# Altium schematic sheet Power_Distribution.SchDoc: Power Distributions
size A3; Organization: Altium Limited; Address1: L3, 12a Rodborough Rd; Address2: Frenchs Forest; Address3: NSW; Address4: Australia 2086
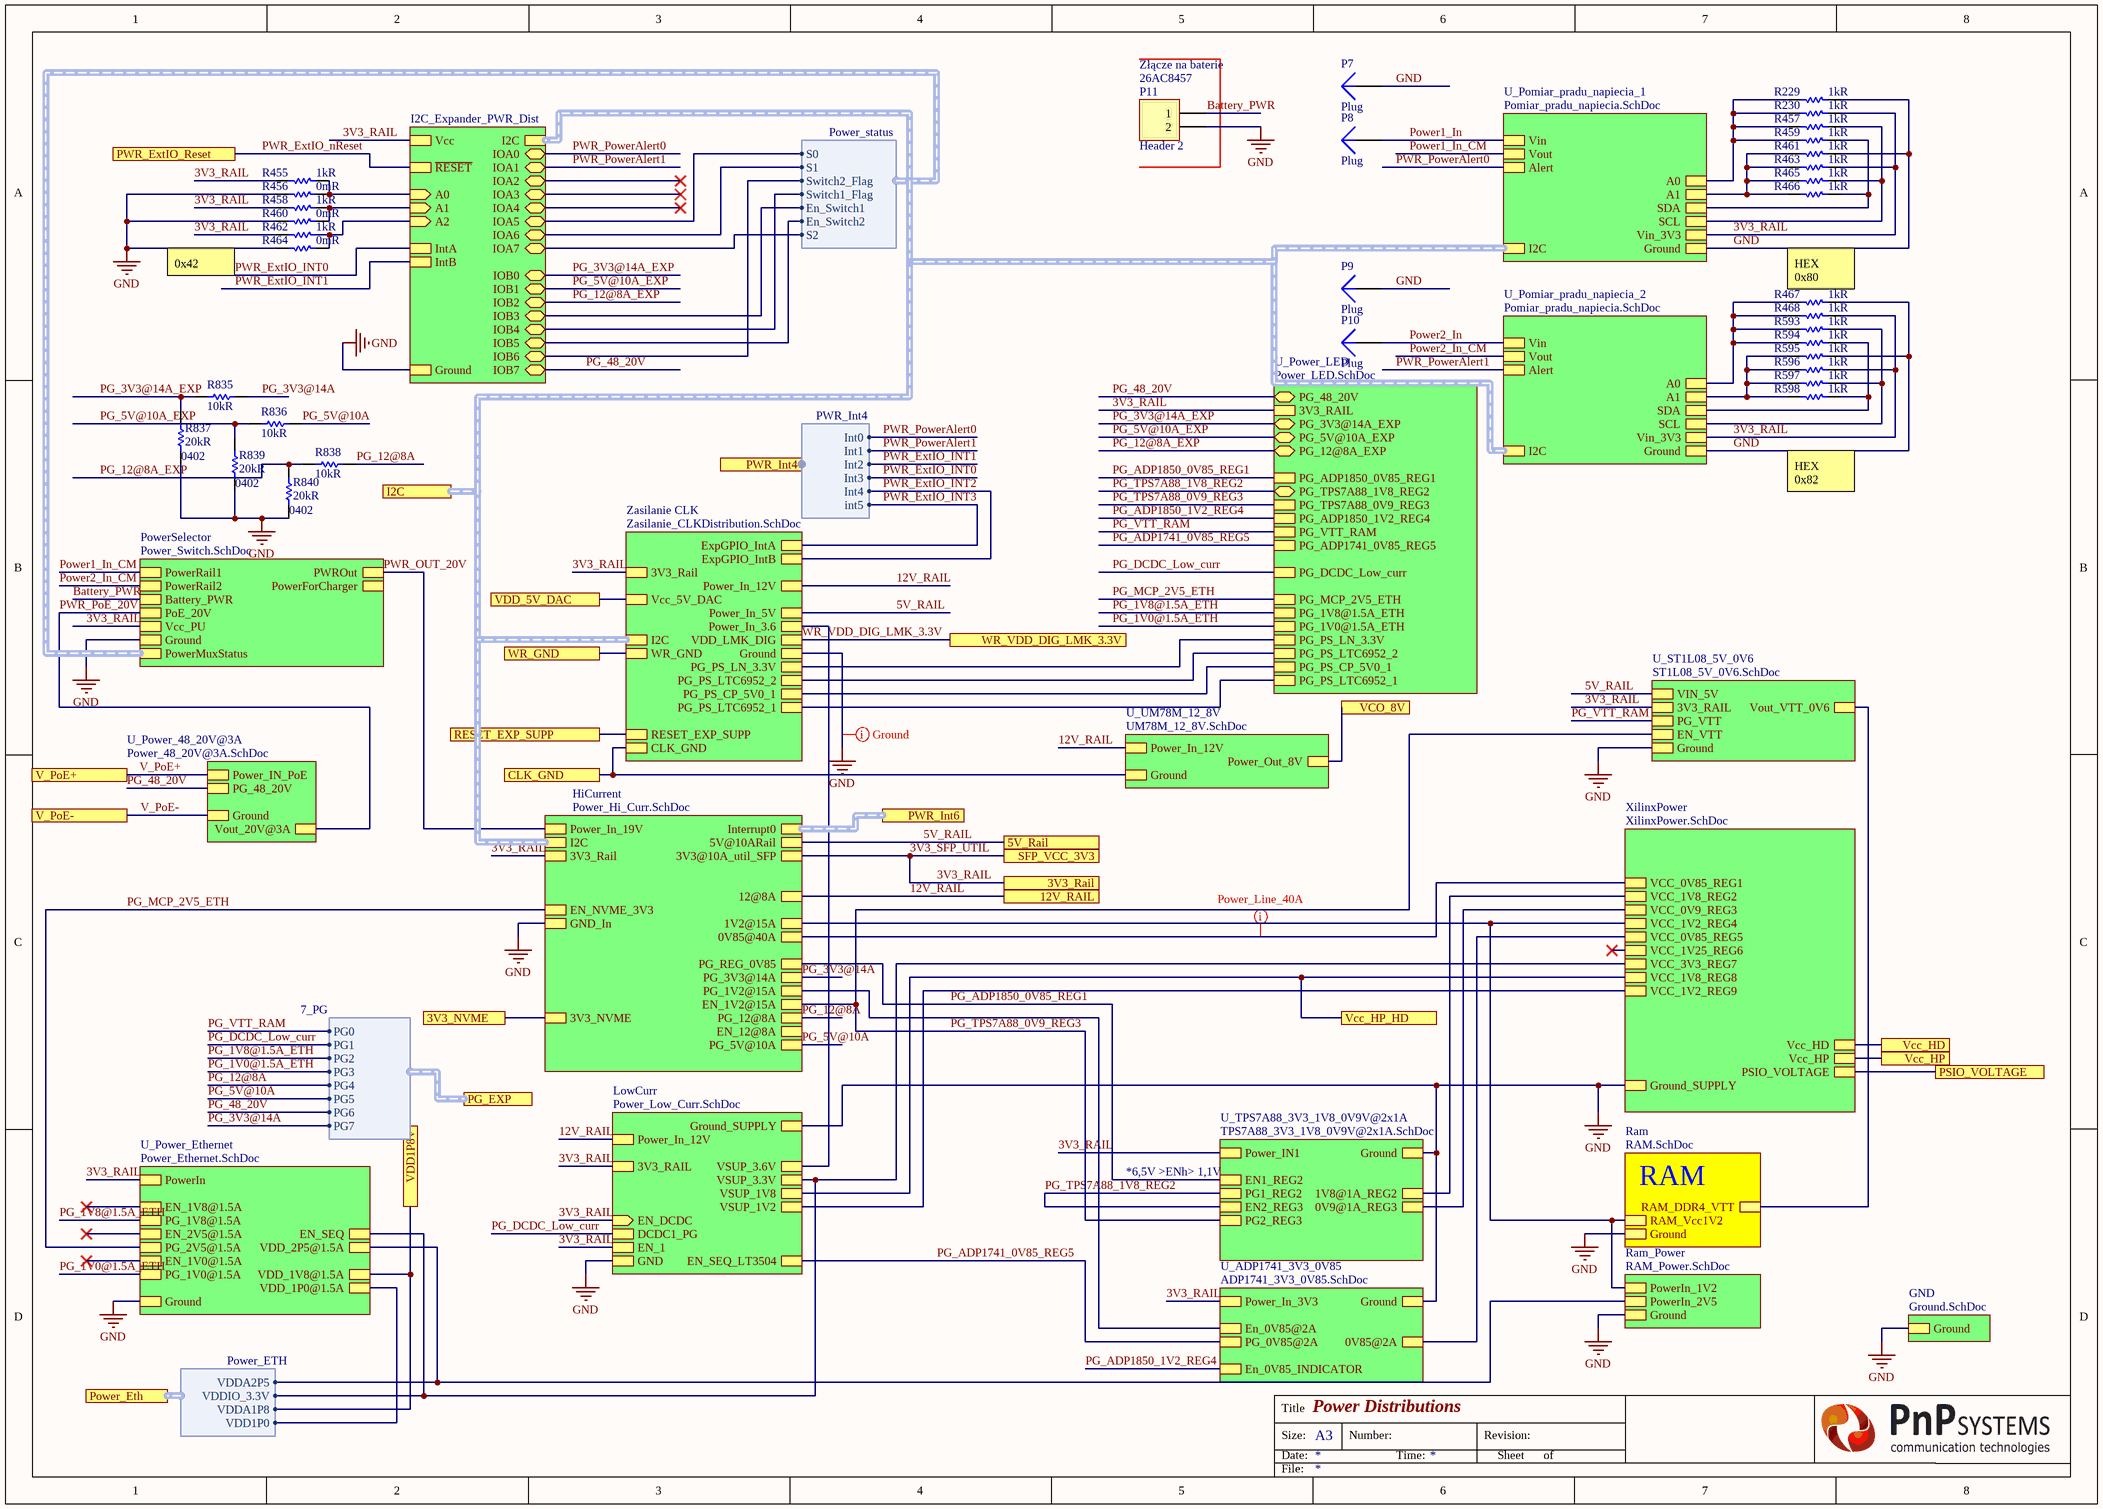
[diagram p0: Power_Distribution.SchDoc]

## Parts
P7  Plug  [PIN1]
P8  Plug  [PIN1]
P9  Plug  [PIN1]
P10  Plug  [PIN1]
P11  Header 2  Supplier Part Number 1: 26AC8457  [HDR1X2]
R229  1kR  [RES 0402/1005 RF KK]
R230  1kR  [RES 0402/1005 RF KK]
R455  1kR  [RES 0402/1005 RF KK]
R456  0mR  [RES 0402/1005 RF KK]
R457  1kR  [RES 0402/1005 RF KK]
R458  1kR  [RES 0402/1005 RF KK]
R459  1kR  [RES 0402/1005 RF KK]
R460  0mR  [RES 0402/1005 RF KK]
R461  1kR  [RES 0402/1005 RF KK]
R462  1kR  [RES 0402/1005 RF KK]
R463  1kR  [RES 0402/1005 RF KK]
R464  0mR  [RES 0402/1005 RF KK]
R465  1kR  [RES 0402/1005 RF KK]
R466  1kR  [RES 0402/1005 RF KK]
R467  1kR  [RES 0402/1005 RF KK]
R468  1kR  [RES 0402/1005 RF KK]
R593  1kR  [RES 0402/1005 RF KK]
R594  1kR  [RES 0402/1005 RF KK]
R595  1kR  [RES 0402/1005 RF KK]
R596  1kR  [RES 0402/1005 RF KK]
R597  1kR  [RES 0402/1005 RF KK]
R598  1kR  [RES 0402/1005 RF KK]
R835  10kR  [RES 0402/1005 RF KK]
R836  10kR  [RES 0402/1005 RF KK]
R837  20kR  Case/Package: 0402  [RES 0402/1005 RF KK]
R838  10kR  [RES 0402/1005 RF KK]
R839  20kR  Case/Package: 0402  [RES 0402/1005 RF KK]
R840  20kR  Case/Package: 0402  [RES 0402/1005 RF KK]

## Sub-sheets
GND = Ground.SchDoc: Ground
HiCurrent = Power_Hi_Curr.SchDoc: 0V85@40A, 1V2@15A, 3V3@10A_util_SFP, 12@8A, Power_In_19V, GND_In, I2C (harness PWR_Int4), 5V@10ARail, 3V3_Rail, Interrupt0 (harness PWR_Interrupt), EN_NVME_3V3, 3V3_NVME, PG_12@8A, PG_1V2@15A, PG_5V@10A, PG_REG_0V85, EN_1V2@15A, EN_12@8A, PG_3V3@14A
I2C_Expander_PWR_Dist = I2C_Expander.SchDoc: IOA7 (bidir), IOA3 (bidir), IOA6 (bidir), IOA1 (bidir), IOA0 (bidir), IOA5 (bidir), IOB1 (bidir), IOB2 (bidir), IOB5 (bidir), IOB6 (bidir), IOB7 (bidir), IntA, IntB, Ground, IOB4 (bidir), IOB3 (bidir), IOA2 (bidir), IOA4 (bidir), IOB0 (bidir), Vcc, ~{RESET}, I2C (harness PWR_Int4), A2 (in), A1 (in), A0 (in)
LowCurr = Power_Low_Curr.SchDoc: Power_In_12V, Ground_SUPPLY, DCDC1_PG, EN_1, VSUP_3.6V, VSUP_3.3V, VSUP_1V8, VSUP_1V2, 3V3_RAIL, GND, EN_DCDC (in), EN_SEQ_LT3504
PowerSelector = Power_Switch.SchDoc: PWROut, Battery_PWR, PowerRail2, PowerRail1, PowerMuxStatus (harness Power_status), Vcc_PU, PowerForCharger, Ground, PoE_20V
Ram = RAM.SchDoc: RAM_DDR4_VTT, RAM_Vcc1V2, Ground
Ram_Power = RAM_Power.SchDoc: PowerIn_1V2, Ground, PowerIn_2V5
U_ADP1741_3V3_0V85 = ADP1741_3V3_0V85.SchDoc: Power_In_3V3, 0V85@2A, En_0V85@2A, PG_0V85@2A, Ground, En_0V85_INDICATOR
U_Pomiar_pradu_napiecia_1 = Pomiar_pradu_napiecia.SchDoc: Vin_3V3, Vin, Vout, Alert, A0, A1, SDA, SCL, Ground, I2C (harness PWR_Int4)
U_Pomiar_pradu_napiecia_2 = Pomiar_pradu_napiecia.SchDoc: Vin_3V3, Vin, Vout, Alert, A0, A1, SDA, SCL, Ground, I2C (harness PWR_Int4)
U_Power_48_20V@3A = Power_48_20V@3A.SchDoc: Ground, Power_IN_PoE, Vout_20V@3A, PG_48_20V
U_Power_Ethernet = Power_Ethernet.SchDoc: VDD_2P5@1.5A, VDD_1V8@1.5A, PowerIn, Ground, VDD_1P0@1.5A, EN_1V8@1.5A, PG_2V5@1.5A, PG_1V8@1.5A, EN_1V0@1.5A, PG_1V0@1.5A, EN_2V5@1.5A, EN_SEQ
U_Power_LED = Power_LED.SchDoc: 3V3_RAIL, PG_3V3@14A_EXP (bidir), PG_5V@10A_EXP (bidir), PG_12@8A_EXP (bidir), PG_ADP1850_0V85_REG1, PG_TPS7A88_1V8_REG2 (bidir), PG_TPS7A88_0V9_REG3, PG_ADP1850_1V2_REG4, PG_VTT_RAM, PG_ADP1741_0V85_REG5, PG_DCDC_Low_curr, PG_48_20V (bidir), PG_PS_LN_3.3V, PG_PS_LTC6952_2, PG_PS_CP_5V0_1, PG_PS_LTC6952_1, PG_MCP_2V5_ETH, PG_1V8@1.5A_ETH, PG_1V0@1.5A_ETH
U_ST1L08_5V_0V6 = ST1L08_5V_0V6.SchDoc: VIN_5V, Vout_VTT_0V6, PG_VTT, EN_VTT, Ground, 3V3_RAIL
U_TPS7A88_3V3_1V8_0V9V@2x1A = TPS7A88_3V3_1V8_0V9V@2x1A.SchDoc: Power_IN1, Ground, 1V8@1A_REG2, 0V9@1A_REG3, PG2_REG3, PG1_REG2, EN2_REG3, EN1_REG2
U_UM78M_12_8V = UM78M_12_8V.SchDoc: Power_In_12V, Power_Out_8V, Ground
XilinxPower = XilinxPower.SchDoc: Ground_SUPPLY, PSIO_VOLTAGE, VCC_1V8_REG8, VCC_0V85_REG1, VCC_1V8_REG2, VCC_0V9_REG3, VCC_1V2_REG4, VCC_0V85_REG5, VCC_1V25_REG6, VCC_1V2_REG9, VCC_3V3_REG7, Vcc_HP, Vcc_HD
Zasilanie CLK = Zasilanie_CLKDistribution.SchDoc: Power_In_12V, Ground, Power_In_5V, Power_In_3.6, 3V3_Rail, VDD_LMK_DIG, Vcc_5V_DAC, WR_GND, CLK_GND, RESET_EXP_SUPP, I2C (harness PWR_Int4), ExpGPIO_IntB, ExpGPIO_IntA, PG_PS_LN_3.3V, PG_PS_LTC6952_2, PG_PS_CP_5V0_1, PG_PS_LTC6952_1

## Ports
3V3_NVME, 3V3_Rail, 5V_Rail, 12V_RAIL, CLK_GND, I2C (harness PWR_Int4), PG_EXP (harness 7_PG), Power_Eth (harness Power_ETH), PSIO_VOLTAGE, PWR_ExtIO_Reset, PWR_Int4 (harness PWR_Int4), PWR_Int6 (harness PWR_Interrupt), RESET_EXP_SUPP, SFP_VCC_3V3, V_PoE+, V_PoE-, Vcc_HD, Vcc_HP, Vcc_HP_HD, VCO_8V, VDD1P8V, VDD_5V_DAC, WR_GND, WR_VDD_DIG_LMK_3.3V

## Harnesses
Power_ETH: VDDA2P5, VDDIO_3.3V, VDDA1P8, VDD1P0
PWR_Int4: Int0, Int1, Int2, Int3, Int4, int5
Power_status: S0, S1, Switch1_Flag, Switch2_Flag, En_Switch1, En_Switch2, S2
7_PG: PG0, PG1, PG2, PG3, PG4, PG5, PG6, PG7

## Nets
GND: P7.1 P9.1 P11.2 R229.2 R456.2 R460.2 R461.2 R464.2 R467.2 R595.2 R837.2 R839.2 R840.2 ; sheet PowerSelector/Ground, sheet HiCurrent/GND_In, sheet LowCurr/Ground_SUPPLY, sheet LowCurr/GND, sheet Zasilanie CLK/Ground, sheet Ram_Power/Ground, sheet XilinxPower/Ground_SUPPLY, sheet Ram/Ground, sheet GND/Ground, sheet U_Power_Ethernet/Ground, sheet I2C_Expander_PWR_Dist/Ground, sheet U_Pomiar_pradu_napiecia_1/Ground, sheet U_Pomiar_pradu_napiecia_2/Ground, sheet U_TPS7A88_3V3_1V8_0V9V@2x1A/Ground, sheet U_ADP1741_3V3_0V85/Ground, sheet U_ST1L08_5V_0V6/Ground
3V3_NVME: port 3V3_NVME, sheet HiCurrent/3V3_NVME
3V3_RAIL: R230.2 R455.1 R458.1 R462.1 R463.2 R468.2 R596.2 ; port SFP_VCC_3V3, port 3V3_Rail, sheet PowerSelector/Vcc_PU, sheet HiCurrent/3V3@10A_util_SFP, sheet HiCurrent/3V3_Rail, sheet LowCurr/EN_1, sheet LowCurr/3V3_RAIL, sheet LowCurr/EN_DCDC, sheet Zasilanie CLK/3V3_Rail, sheet U_Power_Ethernet/PowerIn, sheet I2C_Expander_PWR_Dist/Vcc, sheet U_Pomiar_pradu_napiecia_1/Vin_3V3, sheet U_Pomiar_pradu_napiecia_2/Vin_3V3, sheet U_TPS7A88_3V3_1V8_0V9V@2x1A/Power_IN1, sheet U_ADP1741_3V3_0V85/Power_In_3V3, sheet U_ST1L08_5V_0V6/3V3_RAIL, sheet U_Power_LED/3V3_RAIL  [also labelled 3V3_SFP_UTIL]
5V_RAIL: port 5V_Rail, sheet HiCurrent/5V@10ARail, sheet Zasilanie CLK/Power_In_5V, sheet U_ST1L08_5V_0V6/VIN_5V
12V_RAIL: port 12V_RAIL, sheet HiCurrent/12@8A, sheet LowCurr/Power_In_12V, sheet Zasilanie CLK/Power_In_12V, sheet U_UM78M_12_8V/Power_In_12V
Battery_PWR: P11.1 ; sheet PowerSelector/Battery_PWR
CLK_GND: port CLK_GND, sheet Zasilanie CLK/CLK_GND, sheet U_UM78M_12_8V/Ground
PG_1V0@1.5A_ETH: sheet U_Power_Ethernet/PG_1V0@1.5A, sheet U_Power_LED/PG_1V0@1.5A_ETH, port PG_EXP.PG3
PG_1V8@1.5A_ETH: sheet U_Power_Ethernet/PG_1V8@1.5A, sheet U_Power_LED/PG_1V8@1.5A_ETH, port PG_EXP.PG2
PG_3V3@14A: R835.1 ; sheet HiCurrent/PG_3V3@14A, port PG_EXP.PG7
PG_3V3@14A_EXP: R835.2 R837.1 ; sheet I2C_Expander_PWR_Dist/IOB0, sheet U_Power_LED/PG_3V3@14A_EXP
PG_5V@10A: R836.1 ; sheet HiCurrent/PG_5V@10A, port PG_EXP.PG5
PG_5V@10A_EXP: R836.2 R839.1 ; sheet I2C_Expander_PWR_Dist/IOB1, sheet U_Power_LED/PG_5V@10A_EXP
PG_12@8A: R838.1 ; sheet HiCurrent/PG_12@8A, port PG_EXP.PG4
PG_12@8A_EXP: R838.2 R840.1 ; sheet I2C_Expander_PWR_Dist/IOB2, sheet U_Power_LED/PG_12@8A_EXP
PG_48_20V: sheet I2C_Expander_PWR_Dist/IOB7, sheet U_Power_48_20V@3A/PG_48_20V, sheet U_Power_LED/PG_48_20V, port PG_EXP.PG6
PG_ADP1741_0V85_REG5: sheet LowCurr/EN_SEQ_LT3504, sheet U_ADP1741_3V3_0V85/PG_0V85@2A, sheet U_Power_LED/PG_ADP1741_0V85_REG5
PG_ADP1850_0V85_REG1: sheet HiCurrent/PG_REG_0V85, sheet U_TPS7A88_3V3_1V8_0V9V@2x1A/EN1_REG2, sheet U_Power_LED/PG_ADP1850_0V85_REG1
PG_ADP1850_1V2_REG4: sheet U_ADP1741_3V3_0V85/En_0V85_INDICATOR, sheet U_Power_LED/PG_ADP1850_1V2_REG4
PG_DCDC_Low_curr: sheet LowCurr/DCDC1_PG, sheet U_Power_LED/PG_DCDC_Low_curr, port PG_EXP.PG1
PG_MCP_2V5_ETH: sheet HiCurrent/EN_NVME_3V3, sheet U_Power_Ethernet/PG_2V5@1.5A, sheet U_Power_LED/PG_MCP_2V5_ETH
PG_TPS7A88_0V9_REG3: sheet HiCurrent/EN_1V2@15A, sheet U_TPS7A88_3V3_1V8_0V9V@2x1A/PG2_REG3, sheet U_ST1L08_5V_0V6/EN_VTT, sheet U_Power_LED/PG_TPS7A88_0V9_REG3
PG_TPS7A88_1V8_REG2: sheet U_TPS7A88_3V3_1V8_0V9V@2x1A/PG1_REG2, sheet U_TPS7A88_3V3_1V8_0V9V@2x1A/EN2_REG3, sheet U_Power_LED/PG_TPS7A88_1V8_REG2
PG_VTT_RAM: sheet U_ST1L08_5V_0V6/PG_VTT, sheet U_Power_LED/PG_VTT_RAM, port PG_EXP.PG0
Power1_In: P8.1 ; sheet U_Pomiar_pradu_napiecia_1/Vin
Power1_In_CM: sheet PowerSelector/PowerRail1, sheet U_Pomiar_pradu_napiecia_1/Vout
Power2_In: P10.1 ; sheet U_Pomiar_pradu_napiecia_2/Vin
Power2_In_CM: sheet PowerSelector/PowerRail2, sheet U_Pomiar_pradu_napiecia_2/Vout
PSIO_VOLTAGE: port PSIO_VOLTAGE, sheet XilinxPower/PSIO_VOLTAGE
PWR_ExtIO_INT0: sheet I2C_Expander_PWR_Dist/IntA, port PWR_Int4.Int3
PWR_ExtIO_INT1: sheet I2C_Expander_PWR_Dist/IntB, port PWR_Int4.Int2
PWR_ExtIO_INT2: sheet Zasilanie CLK/ExpGPIO_IntB, port PWR_Int4.Int4
PWR_ExtIO_INT3: sheet Zasilanie CLK/ExpGPIO_IntA, port PWR_Int4.int5
PWR_ExtIO_nReset: port PWR_ExtIO_Reset, sheet I2C_Expander_PWR_Dist/~{RESET}
PWR_OUT_20V: sheet PowerSelector/PWROut, sheet HiCurrent/Power_In_19V
PWR_PoE_20V: sheet PowerSelector/PoE_20V, sheet U_Power_48_20V@3A/Vout_20V@3A
PWR_PowerAlert0: sheet I2C_Expander_PWR_Dist/IOA0, sheet U_Pomiar_pradu_napiecia_1/Alert, port PWR_Int4.Int0
PWR_PowerAlert1: sheet I2C_Expander_PWR_Dist/IOA1, sheet U_Pomiar_pradu_napiecia_2/Alert, port PWR_Int4.Int1
RESET_EXP_SUPP: port RESET_EXP_SUPP, sheet Zasilanie CLK/RESET_EXP_SUPP
V_PoE+: port V_PoE+, sheet U_Power_48_20V@3A/Power_IN_PoE
V_PoE-: port V_PoE-, sheet U_Power_48_20V@3A/Ground
Vcc_HD: port Vcc_HD, sheet XilinxPower/Vcc_HD
Vcc_HP: port Vcc_HP, sheet XilinxPower/Vcc_HP
Vcc_HP_HD: port Vcc_HP_HD, sheet LowCurr/VSUP_1V8, sheet XilinxPower/VCC_1V8_REG8
VCO_8V: port VCO_8V, sheet U_UM78M_12_8V/Power_Out_8V
VDD1P8V: port VDD1P8V, sheet U_Power_Ethernet/VDD_1V8@1.5A, port Power_Eth.VDDA1P8
VDD_5V_DAC: port VDD_5V_DAC, sheet Zasilanie CLK/Vcc_5V_DAC
WR_GND: port WR_GND, sheet Zasilanie CLK/WR_GND
WR_VDD_DIG_LMK_3.3V: port WR_VDD_DIG_LMK_3.3V, sheet Zasilanie CLK/VDD_LMK_DIG
NetR229_1: R229.1 R230.1 R457.1 R459.1 ; sheet U_Pomiar_pradu_napiecia_1/A0
NetR455_2: R455.2 R456.1 ; sheet I2C_Expander_PWR_Dist/A0
NetR457_2: R457.2 R465.2 ; sheet U_Pomiar_pradu_napiecia_1/SCL
NetR458_2: R458.2 R460.1 ; sheet I2C_Expander_PWR_Dist/A1
NetR459_2: R459.2 R466.2 ; sheet U_Pomiar_pradu_napiecia_1/SDA
NetR461_1: R461.1 R463.1 R465.1 R466.1 ; sheet U_Pomiar_pradu_napiecia_1/A1
NetR462_2: R462.2 R464.1 ; sheet I2C_Expander_PWR_Dist/A2
NetR467_1: R467.1 R468.1 R593.1 R594.1 ; sheet U_Pomiar_pradu_napiecia_2/A0
NetR593_2: R593.2 R597.2 ; sheet U_Pomiar_pradu_napiecia_2/SCL
NetR594_2: R594.2 R598.2 ; sheet U_Pomiar_pradu_napiecia_2/SDA
NetR595_1: R595.1 R596.1 R597.1 R598.1 ; sheet U_Pomiar_pradu_napiecia_2/A1
(unnamed): sheet HiCurrent/0V85@40A, sheet XilinxPower/VCC_0V85_REG1
(unnamed): sheet HiCurrent/1V2@15A, sheet Ram_Power/PowerIn_1V2, sheet XilinxPower/VCC_1V2_REG4, sheet Ram/RAM_Vcc1V2
(unnamed): sheet HiCurrent/PG_1V2@15A, sheet U_ADP1741_3V3_0V85/En_0V85@2A
(unnamed): sheet LowCurr/VSUP_3.6V, sheet Zasilanie CLK/Power_In_3.6
(unnamed): sheet LowCurr/VSUP_3.3V, sheet XilinxPower/VCC_3V3_REG7, sheet U_Power_Ethernet/EN_SEQ, port Power_Eth.VDDIO_3.3V
(unnamed): sheet LowCurr/VSUP_1V2, sheet XilinxPower/VCC_1V2_REG9
(unnamed): sheet Zasilanie CLK/PG_PS_LN_3.3V, sheet U_Power_LED/PG_PS_LN_3.3V
(unnamed): sheet Zasilanie CLK/PG_PS_LTC6952_2, sheet U_Power_LED/PG_PS_LTC6952_2
(unnamed): sheet Zasilanie CLK/PG_PS_CP_5V0_1, sheet U_Power_LED/PG_PS_CP_5V0_1
(unnamed): sheet Zasilanie CLK/PG_PS_LTC6952_1, sheet U_Power_LED/PG_PS_LTC6952_1
(unnamed): sheet Ram_Power/PowerIn_2V5, sheet U_Power_Ethernet/VDD_2P5@1.5A, port Power_Eth.VDDA2P5
(unnamed): sheet XilinxPower/VCC_1V8_REG2, sheet U_TPS7A88_3V3_1V8_0V9V@2x1A/1V8@1A_REG2
(unnamed): sheet XilinxPower/VCC_0V9_REG3, sheet U_TPS7A88_3V3_1V8_0V9V@2x1A/0V9@1A_REG3
(unnamed): sheet XilinxPower/VCC_0V85_REG5, sheet U_ADP1741_3V3_0V85/0V85@2A
(unnamed): sheet Ram/RAM_DDR4_VTT, sheet U_ST1L08_5V_0V6/Vout_VTT_0V6
(unnamed): sheet U_Power_Ethernet/VDD_1P0@1.5A, port Power_Eth.VDD1P0
(unnamed): sheet I2C_Expander_PWR_Dist/IOA7, sheet PowerSelector/PowerMuxStatus.S2
(unnamed): sheet I2C_Expander_PWR_Dist/IOA6, sheet PowerSelector/PowerMuxStatus.S1
(unnamed): sheet I2C_Expander_PWR_Dist/IOA5, sheet PowerSelector/PowerMuxStatus.S0
(unnamed): sheet I2C_Expander_PWR_Dist/IOB5, sheet PowerSelector/PowerMuxStatus.En_Switch2
(unnamed): sheet I2C_Expander_PWR_Dist/IOB6, sheet PowerSelector/PowerMuxStatus.Switch2_Flag
(unnamed): sheet I2C_Expander_PWR_Dist/IOB4, sheet PowerSelector/PowerMuxStatus.Switch1_Flag
(unnamed): sheet I2C_Expander_PWR_Dist/IOB3, sheet PowerSelector/PowerMuxStatus.En_Switch1

## Buses and harness runs
harness port I2C = sheet HiCurrent/I2C = sheet I2C_Expander_PWR_Dist/I2C = sheet U_Pomiar_pradu_napiecia_1/I2C = sheet U_Pomiar_pradu_napiecia_2/I2C = sheet Zasilanie CLK/I2C
harness port PWR_Int6 = sheet HiCurrent/Interrupt0

## Layout directives
net class Power_Line_40A: (no net found under the mark)
net class Ground: GND

## Notes on the sheet
- (near P11) Złącze na baterie
- 0x42
- (near R467) HEX
  0x80
- HEX
  0x82
- *6,5V >ENh> 1,1V
- RAM
- Title
- Size:
- Date:
- A3
- Number:
- Time:
- Revision:
- Sheet
- of
- File:

## Library data of the parts
P11 = Header 2: 00000005000HDR ASSY F/L SQ STR; Manufacturer: TE Connectivity; Manufacturer Part Number: 640456-2; Connector Type: Connector,Pin,Plug,Header; Shrouded: No (Without); Contact Current Rating: 5A; Connector System: Wire-to-Board; Plating Thickness: 3.81um; PCB Mount Retention: Without; Contact Resistance: 6mR; Max Voltage Rating (AC): 250V; Number of Positions: 2; Gender: Male; Contact Style: Straight; Mating Connector Lock: Yes (With); PCB Mounting Orientation: Vertical; Circuit Application: Signal; Pitch: 2.54mm; PCB Thickness: 0.063inch; Tail Length: 0.14inch; Contact Post Length: 3.56mm; Approvals: CSA; LatestRevisionDate: 17-Jul-2002; LatestRevisionNote: Re-released for DXP Platform.; Publisher: Altium Limited; Supplier 1: Newark; RoHS: Yes; Category: Headers and Wire Housings; Pricing 1: 1=0,11200, 10=0,08100, 25=0,07600, 100=0,06900, 500=0,05800, 1000=0,05100, 2500=0,04700 (USD); Mount: Through Hole; Color: Natural,White,Beige; Contact Plating: Tin; Contact Material: Copper Alloy; Housing Material: Polyester; Housing Color: Natural; Contact Shape: Square; Min Operating Temperature: -67°C; Max Operating Temperature: 221°C; Package Quantity: 5000; Packaging: Bulk; Termination: Solder; Number of Rows: 1; Backwall/Post Interruptions: No (Without); Fastening Type: Friction; Contact Retention: No (Without); Mating Alignment: No (Without); Mating Retention: No (Without); PCB Mount Alignment: No (Without); Sealable: No (Without); Strain Relief: No (Without); Contact Gender: Male; Voltage Rating (AC): 250V; Orientation: Straight; Number of Contacts: 2; Current Rating: 5A; Mounting Ears: No (Without); Number of Poles: 2; Panel Mount Retention: No (Without); Voltage Rating: 250V; Working Voltage: 250V; Length: 7.62mm; Height: 7.87mm; Depth: 5.72mm; Lead Pitch: 2.54mm; Contact Mating Length: 7.49mm; Radiation Hardening: No; ELV: Compliant; Lead Free: Lead Free; Flammability Rating: UL94 V-0; REACH SVHC: No SVHC; ComponentLink1URL: https://datasheet.ciiva.com/709/eng-cd-640456-w1-709680.pdf?src-supplier=Digi-Key; ComponentLink1Description: https://datasheet.ciiva.com/709/eng-cd-640456-w1-709680.pdf?src-supplier=Digi-Key; ComponentLink2URL: https://datasheet.ciiva.com/3118/eng-ds-82056-mta-0608-3118497.pdf?src-supplier=Avnet; ComponentLink2Description: https://datasheet.ciiva.com/3118/eng-ds-82056-mta-0608-3118497.pdf?src-supplier=Avnet; ComponentLink3URL: https://datasheet.ciiva.com/14156/04384301-14156820.pdf?src-supplier=Distrelec; ComponentLink3Description: https://datasheet.ciiva.com/14156/04384301-14156820.pdf?src-supplier=Distrelec; ComponentLink4URL: https://datasheet.ciiva.com/16401/eng-ds-82056-mta-0608-16401289.pdf?src-supplier=Future+Electronics; ComponentLink4Description: https://datasheet.ciiva.com/16401/eng-ds-82056-mta-0608-16401289.pdf?src-supplier=Future+Electronics; ComponentLink5URL: https://datasheet.ciiva.com/25617/0900766b80027008-25617244.pdf?src-supplier=RSComponents; ComponentLink5Description: https://datasheet.ciiva.com/25617/0900766b80027008-25617244.pdf?src-supplier=RSComponents; ComponentLink6URL: https://datasheet.ciiva.com/11746/0900766b80eb7fdd-11746365.pdf?src-supplier=RSComponents; ComponentLink6Description: https://datasheet.ciiva.com/11746/0900766b80eb7fdd-11746365.pdf?src-supplier=RSComponents; ComponentLink7URL: https://datasheet.ciiva.com/7128/1866390-7128742.pdf?src-supplier=Newark; ComponentLink7Description: https://datasheet.ciiva.com/7128/1866390-7128742.pdf?src-supplier=Newark; ComponentLink8URL: https://datasheet.ciiva.com/16505/eng-ds-82056-mta-0608-16505419.pdf?src-supplier=Avnet+Asia; ComponentLink8Description: https://datasheet.ciiva.com/16505/eng-ds-82056-mta-0608-16505419.pdf?src-supplier=Avnet+Asia
R229 R230 R455 R457-R459 R461-R463 R465-R468 R593-R598 = Resistor: PANASONIC - ERJ-2RKF1001X - SMD Chip Resistor, 0402 [1005 Metric], 1 kohm, ERJ2R Series, 50 V, Thick Film, 100 mW; Temperature Coefficient: 100ppm/°C; Tolerance: 1%; Voltage Rating (DC): 50V; Power Rating: 100mW; Supplier 1: Digi-Key; Supplier Part Number 1: P1.00KLDKR-ND; Manufacturer: Panasonic; Manufacturer Part Number: ERJ-2RKF1001X; RoHS: Yes; Category: Chip SMD Resistors; Stock 1: 1864188; Pricing 1: 1=0,10000, 10=0,04300, 100=0,01740, 1000=0,00782, 2500=0,00678, 5000=0,00561 (USD); Mount: Surface Mount; Case/Package: 0402; Number of Pins: 2; Contact Plating: Tin; Case Code (Imperial): 0402; Case Code (Metric): 1005; Min Operating Temperature: -55°C; Max Operating Temperature: 155°C; Composition: Thick Film; Resistance: 1kR; Termination: SMD/SMT; Number of Terminations: 2; Military Standard: Not; Features: Automotive AEC-Q200; Packaging: Tape and Reel; Voltage Rating: 50V; Package Quantity: 1; Max Power Dissipation: 100mW; Working Voltage: 50V; Length: 1mm; Height: 0.35mm; Depth: 0.5mm; Width: 0.5mm; Radiation Hardening: No; Lead Free: Lead Free; REACH SVHC: No SVHC; ComponentLink1URL: https://datasheet.ciiva.com/11821/0900766b80f80784-11821203.pdf?src-supplier=RSComponents; ComponentLink1Description: https://datasheet.ciiva.com/11821/0900766b80f80784-11821203.pdf?src-supplier=RSComponents; ComponentLink2URL: https://datasheet.ciiva.com/7942/aoa0000ce2-7942426.pdf?src-supplier=Element14; ComponentLink2Description: https://datasheet.ciiva.com/7942/aoa0000ce2-7942426.pdf?src-supplier=Element14; ComponentLink3URL: https://datasheet.ciiva.com/16523/aoa0000ce2-16523834.pdf?src-supplier=Avnet+Asia; ComponentLink3Description: https://datasheet.ciiva.com/16523/aoa0000ce2-16523834.pdf?src-supplier=Avnet+Asia; ComponentLink4URL: https://datasheet.ciiva.com/17215/aoa0000ce2-17215308.pdf?src-supplier=Avnet+Europe; ComponentLink4Description: https://datasheet.ciiva.com/17215/aoa0000ce2-17215308.pdf?src-supplier=Avnet+Europe; ComponentLink5URL: https://datasheet.ciiva.com/22673/1678782-22673916.pdf?src-supplier=Element14; ComponentLink5Description: https://datasheet.ciiva.com/22673/1678782-22673916.pdf?src-supplier=Element14; ComponentLink6URL: https://datasheet.ciiva.com/28532/1678782-28532109.pdf?src-supplier=Element14; ComponentLink6Description: https://datasheet.ciiva.com/28532/1678782-28532109.pdf?src-supplier=Element14; ComponentLink7URL: https://datasheet.ciiva.com/16767/70260748-16767559.pdf?src-supplier=Allied+Electronics; ComponentLink7Description: https://datasheet.ciiva.com/16767/70260748-16767559.pdf?src-supplier=Allied+Electronics; ComponentLink8URL: https://datasheet.ciiva.com/9198/aoa0000ce2-9198920.pdf?src-supplier=Avnet; ComponentLink8Description: https://datasheet.ciiva.com/9198/aoa0000ce2-9198920.pdf?src-supplier=Avnet; ComponentLink9URL: https://datasheet.ciiva.com/16771/70260748-16771979.pdf?src-supplier=Allied+Electronics; ComponentLink9Description: https://datasheet.ciiva.com/16771/70260748-16771979.pdf?src-supplier=Allied+Electronics
R456 R460 R464 = Resistor: Manufacturer 1: Yageo; Manufacturer Part Number 1: RC0402JR-070RL; Power Rating: 62.5mW; Tolerance: 5%; Voltage Rating: 50V; Max Power Dissipation: 63mW; Temperature Coefficient: 200ppm/°C; Supplier 1: Digi-Key; Supplier Part Number 1: 311-0.0JRCT-ND; Stock 1: 69822252; Pricing 1: 1=0.10000, 10=0.01200, 25=0.00920, 50=0.00680, 100=0.00510, 250=0.00388, 500=0.00308, 1000=0.00227, 5000=0.00163 (USD); RoHS: Yes; Case/Package: 0402; Contact Plating: Tin,Matte; Case Code (Metric): 1005; Case Code (Imperial): 0402; Min Operating Temperature: -55°C; Max Operating Temperature: 155°C; Resistance: 0mR; Packaging: Tape and Reel; Composition: Thick Film; Package Quantity: 1; Number of Terminations: 2; Termination: SMD/SMT; Military Standard: Not; Features: Moisture Resistant; Length: 1mm; Height: 0.016inch; Width: 0.02inch; Depth: 0.5mm; Radiation Hardening: No; REACH SVHC: Unknown; Lead Free: Lead Free; ComponentLink1URL: https://datasheet.ciiva.com/2452/pyu-rc0402-51-rohs-l-6-2452608.pdf?src-supplier=Digi-Key; ComponentLink1Description: https://datasheet.ciiva.com/2452/pyu-rc0402-51-rohs-l-6-2452608.pdf?src-supplier=Digi-Key; ComponentLink2URL: https://datasheet.ciiva.com/11808/0900766b80c66297-11808195.pdf?src-supplier=RSComponents; ComponentLink2Description: https://datasheet.ciiva.com/11808/0900766b80c66297-11808195.pdf?src-supplier=RSComponents; ComponentLink3URL: https://datasheet.ciiva.com/2452/pyu-r-int-thick-7-2452609.pdf?src-supplier=Digi-Key; ComponentLink3Description: https://datasheet.ciiva.com/2452/pyu-r-int-thick-7-2452609.pdf?src-supplier=Digi-Key; ComponentLink4URL: https://datasheet.ciiva.com/22747/1018594-22747515.pdf?src-supplier=Element14; ComponentLink4Description: https://datasheet.ciiva.com/22747/1018594-22747515.pdf?src-supplier=Element14; ComponentLink5URL: https://datasheet.ciiva.com/7983/1018594-7983535.pdf?src-supplier=Element14; ComponentLink5Description: https://datasheet.ciiva.com/7983/1018594-7983535.pdf?src-supplier=Element14; ComponentLink6URL: https://datasheet.ciiva.com/2452/pyu-r-int-thick-7-2452610.pdf?src-supplier=Digi-Key; ComponentLink6Description: https://datasheet.ciiva.com/2452/pyu-r-int-thick-7-2452610.pdf?src-supplier=Digi-Key; ComponentLink7URL: https://datasheet.ciiva.com/8896/pyu-rc0402-51-rohs-l-6-8896201.pdf?src-supplier=Avnet; ComponentLink7Description: https://datasheet.ciiva.com/8896/pyu-rc0402-51-rohs-l-6-8896201.pdf?src-supplier=Avnet; ComponentLink8URL: https://datasheet.ciiva.com/28386/pyu-rc0402-51-rohs-l-6-28386633.pdf?src-supplier=Avnet+Europe; ComponentLink8Description: https://datasheet.ciiva.com/28386/pyu-rc0402-51-rohs-l-6-28386633.pdf?src-supplier=Avnet+Europe; ComponentLink9URL: https://datasheet.ciiva.com/15189/getdatasheetpartid-326379-15189533.pdf?src-supplier=Verical; ComponentLink9Description: https://datasheet.ciiva.com/15189/getdatasheetpartid-326379-15189533.pdf?src-supplier=Verical
R835 R836 R838 = Resistor: Manufacturer 1: Yageo; Manufacturer Part Number 1: RC0402FR-0710KL; Tolerance: 1%; Temperature Coefficient: 100ppm/°C; Voltage Rating: 50V; Power Rating: 62.5mW; Supplier 1: Digi-Key; Supplier Part Number 1: 311-10.0KLRCT-ND; Stock 1: 71214322; Pricing 1: 1=0,10000, 10=0,01500, 100=0,00600, 1000=0,00270, 2500=0,00235, 5000=0,00194 (USD); RoHS: Yes; Case/Package: 0402; Number of Pins: 2; Case Code (Imperial): 0402; Case Code (Metric): 1005; Min Operating Temperature: -55°C; Max Operating Temperature: 155°C; Resistance: 10kR; Packaging: Tape and Reel; Composition: Thick Film; Voltage Rating (DC): 50V; Termination: SMD/SMT; Military Standard: Not; Working Voltage: 50V; Number of Terminations: 2; Length: 1mm; Height: 0.32mm; Width: 0.5mm; Depth: 0.5mm; Lead Pitch: 0.2mm; REACH SVHC: No SVHC; Lead Free: Lead Free; ComponentLink1URL: https://datasheet.ciiva.com/7660/38568-7660787.pdf?src-supplier=Element14; ComponentLink1Description: https://datasheet.ciiva.com/7660/38568-7660787.pdf?src-supplier=Element14; ComponentLink2URL: https://datasheet.ciiva.com/7849/1784430-7849813.pdf?src-supplier=Element14; ComponentLink2Description: https://datasheet.ciiva.com/7849/1784430-7849813.pdf?src-supplier=Element14; ComponentLink3URL: https://datasheet.ciiva.com/7849/1686128-7849814.pdf?src-supplier=Element14; ComponentLink3Description: https://datasheet.ciiva.com/7849/1686128-7849814.pdf?src-supplier=Element14; ComponentLink4URL: https://datasheet.ciiva.com/7849/1784430-7849815.pdf?src-supplier=Element14; ComponentLink4Description: https://datasheet.ciiva.com/7849/1784430-7849815.pdf?src-supplier=Element14; ComponentLink5URL: https://datasheet.ciiva.com/22747/1018594-22747512.pdf?src-supplier=Element14; ComponentLink5Description: https://datasheet.ciiva.com/22747/1018594-22747512.pdf?src-supplier=Element14; ComponentLink6URL: https://datasheet.ciiva.com/12667/pyu-rc0402-51-rohs-l-6-r-12667067.pdf?src-supplier=Mouser; ComponentLink6Description: https://datasheet.ciiva.com/12667/pyu-rc0402-51-rohs-l-6-r-12667067.pdf?src-supplier=Mouser; ComponentLink7URL: https://datasheet.ciiva.com/7983/1018594-7983486.pdf?src-supplier=Element14; ComponentLink7Description: https://datasheet.ciiva.com/7983/1018594-7983486.pdf?src-supplier=Element14
R837 R839 R840 = Resistor: Manufacturer: Panasonic; Manufacturer Part Number: ERJ-2RKF2002X; Power Rating: 100mW; Tolerance: 1%; Voltage Rating: 50V; Temperature Coefficient: 100ppm/°C; Supplier 1: Digi-Key; Supplier Part Number 1: P20.0KLCT-ND; Stock 1: 2516725; Pricing 1: 1 = 0,10000, 10 = 0,05000, 100 = 0,02050, 1000 = 0,00920, 2500 = 0,00798, 5000 = 0,00660 (USD); RoHS: Yes; Mount: Surface Mount; Weight: 2.8E-05oz; Case Code (Metric): 1005; Case Code (Imperial): 0402; Contact Plating: Tin; Min Operating Temperature: -55°C; Max Operating Temperature: 155°C; Resistance: 20kR; Packaging: Cut Tape; Package Quantity: 1; Composition: Thick Film; Number of Terminations: 2; Termination: SMD/SMT; Military Standard: Not; Max Power Dissipation: 100mW; Voltage Rating (DC): 50V; Features: Automotive AEC-Q200; Length: 1mm; Height: 0.35mm; Width: 0.02inch; Depth: 0.5mm; Radiation Hardening: No; REACH SVHC: No SVHC; Lead Free: Lead Free; ComponentLink1URL: https://datasheet.ciiva.com/11821/0900766b80f80784-11821220.pdf?src-supplier=RSComponents; ComponentLink1Description: https://datasheet.ciiva.com/11821/0900766b80f80784-11821220.pdf?src-supplier=RSComponents; ComponentLink2URL: https://datasheet.ciiva.com/16762/70260748-16762885.pdf?src-supplier=Allied+Electronics; ComponentLink2Description: https://datasheet.ciiva.com/16762/70260748-16762885.pdf?src-supplier=Allied+Electronics; ComponentLink3URL: https://datasheet.ciiva.com/16782/70260748-16782455.pdf?src-supplier=Allied+Electronics; ComponentLink3Description: https://datasheet.ciiva.com/16782/70260748-16782455.pdf?src-supplier=Allied+Electronics; ComponentLink4URL: https://datasheet.ciiva.com/48531/aoa0000ce2-48531063.pdf?src-supplier=Avnet; ComponentLink4Description: https://datasheet.ciiva.com/48531/aoa0000ce2-48531063.pdf?src-supplier=Avnet; ComponentLink5URL: https://datasheet.ciiva.com/28688/1678782-28688600.pdf?src-supplier=Element14; ComponentLink5Description: https://datasheet.ciiva.com/28688/1678782-28688600.pdf?src-supplier=Element14; ComponentLink6URL: https://datasheet.ciiva.com/46377/426256-46377368.pdf?src-supplier=Element14; ComponentLink6Description: https://datasheet.ciiva.com/46377/426256-46377368.pdf?src-supplier=Element14; ComponentLink7URL: https://datasheet.ciiva.com/6138/426256-6138761.pdf?src-supplier=Farnell; ComponentLink7Description: https://datasheet.ciiva.com/6138/426256-6138761.pdf?src-supplier=Farnell; ComponentLink8URL: https://datasheet.ciiva.com/24159/aoa0000ce2-24159274.pdf?src-supplier=Mouser; ComponentLink8Description: https://datasheet.ciiva.com/24159/aoa0000ce2-24159274.pdf?src-supplier=Mouser; ComponentLink9URL: https://datasheet.ciiva.com/16508/aoa0000ce2-16508524.pdf?src-supplier=Future+Electronics; ComponentLink9Description: https://datasheet.ciiva.com/16508/aoa0000ce2-16508524.pdf?src-supplier=Future+Electronics; ComponentLink10URL: https://datasheet.ciiva.com/16514/aoa0000ce2-16514269.pdf?src-supplier=Avnet+Asia; ComponentLink10Description: https://datasheet.ciiva.com/16514/aoa0000ce2-16514269.pdf?src-supplier=Avnet+Asia; ComponentLink11URL: https://datasheet.ciiva.com/30049/aoa0000ce2-30049982.pdf?src-supplier=Onlinecomponents.com; ComponentLink11Description: https://datasheet.ciiva.com/30049/aoa0000ce2-30049982.pdf?src-supplier=Onlinecomponents.com
P7-P10 = Plug: LatestRevisionDate: 17-Jul-2002; LatestRevisionNote: Re-released for DXP Platform.; Publisher: Altium Limited